# EAGLE design C3-Carrier-RevC (EAGLE 9.7.0)

## Sheet 1 of 4: CHARGING & CELL PROTECTION
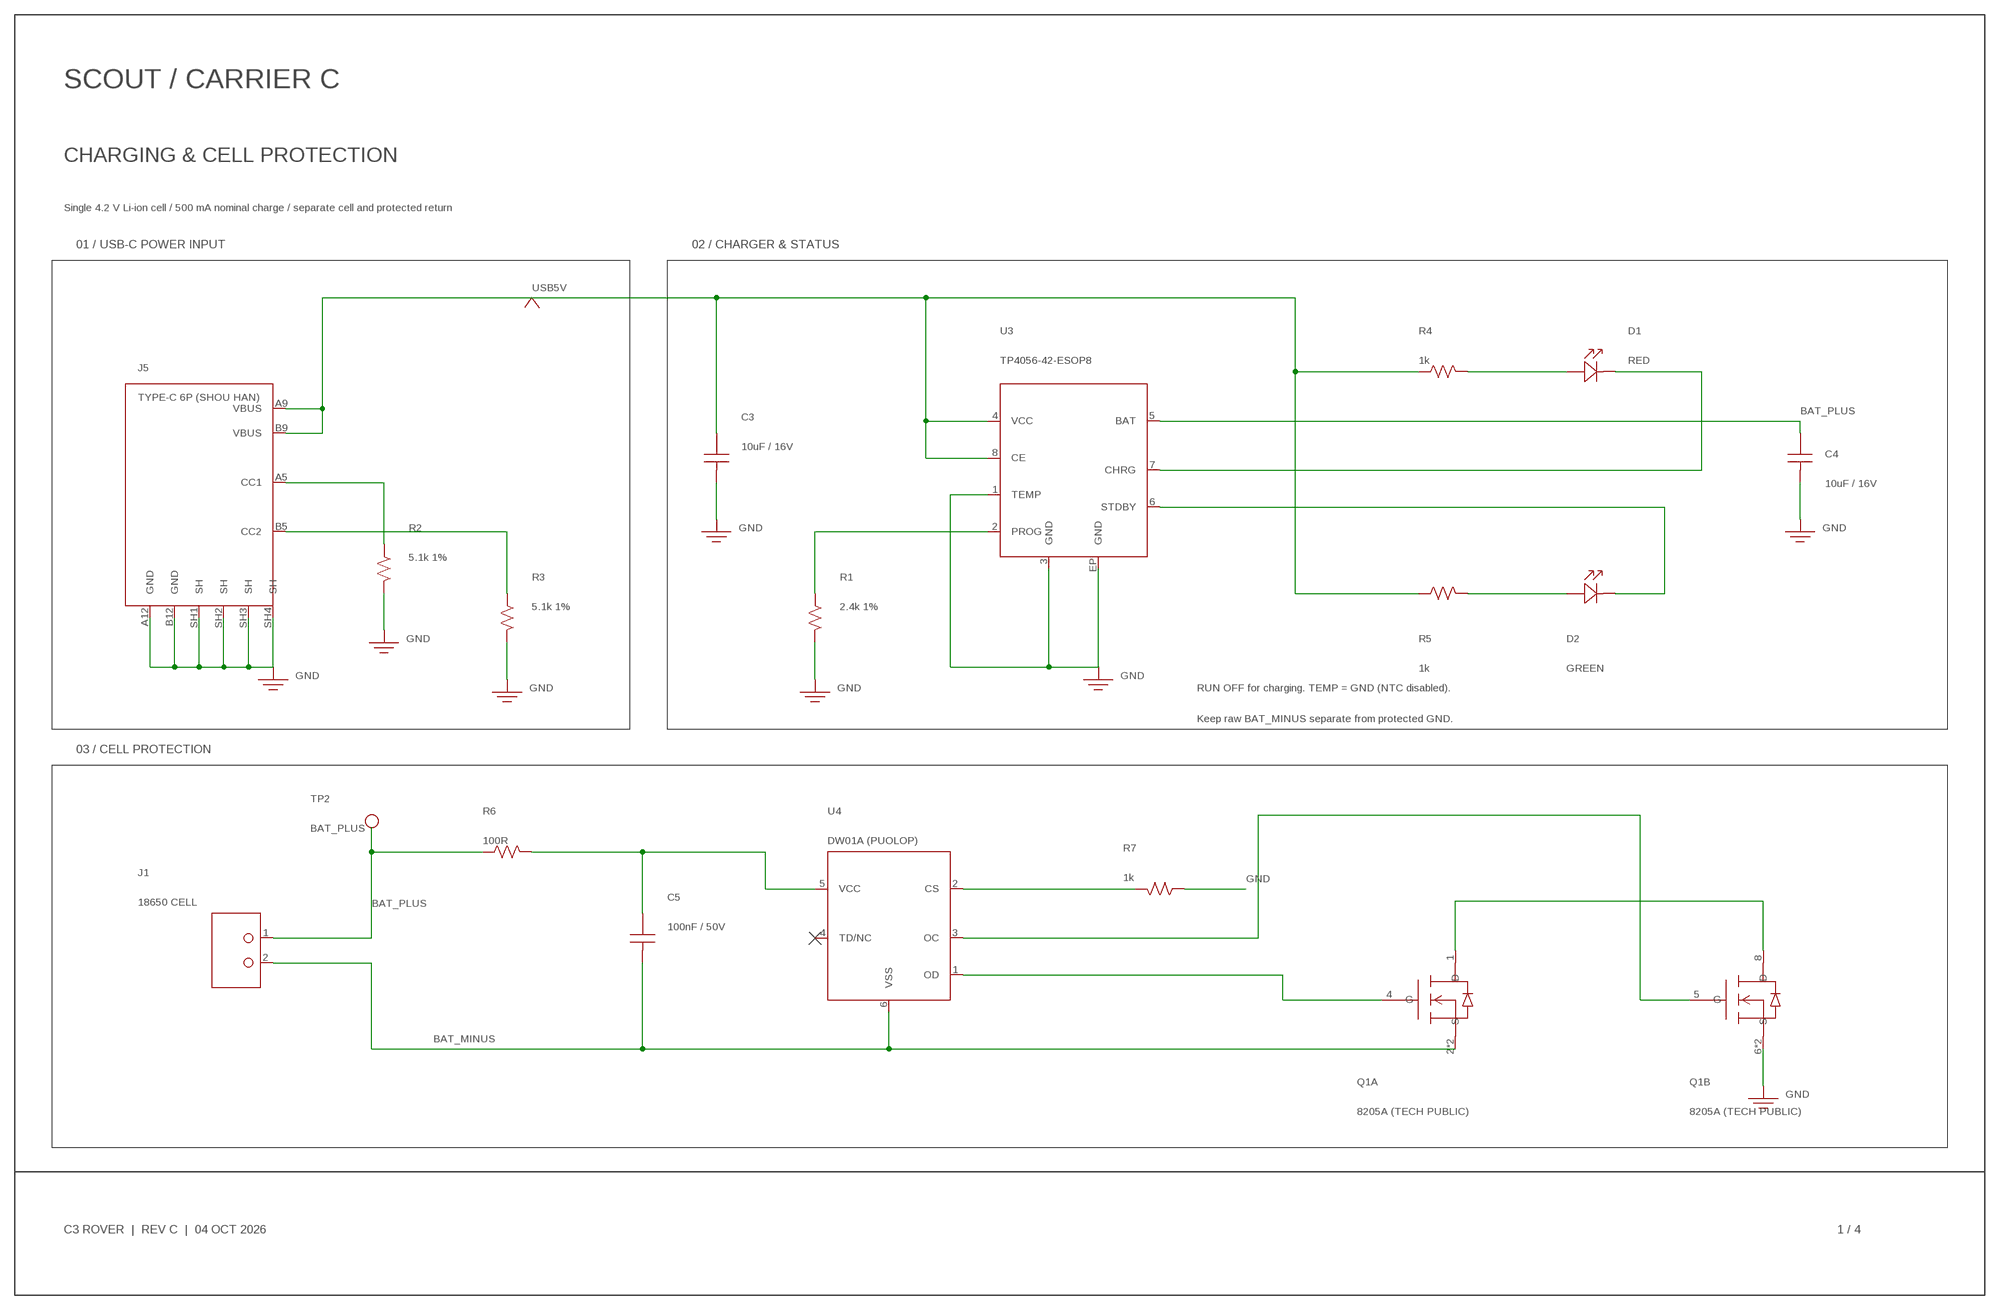
[diagram p0: schematic, sheet 1]

### Parts
C3  10uF / 16V  C1206  [C1206]
C4  10uF / 16V  C1206  [C1206]
C5  100nF / 50V  C0805  [C0805]
D1  RED  LED0805  [LED0805]
D2  GREEN  LED0805  [LED0805]
J1  18650 CELL  WIRE2  [WIRE2-3.5]
J5  TYPE-C 6P (SHOU HAN)  USBC  [USB-C-SHOUHAN-6P-C456012]
Q1  8205A (TECH PUBLIC)  FS8205A  [TSSOP8-0.65]
R1  2.4k 1%  R0805  [R0805]
R2  5.1k 1%  R0805  [R0805]
R3  5.1k 1%  R0805  [R0805]
R4  1k  R0805  [R0805]
R5  1k  R0805  [R0805]
R6  100R  R0805  [R0805]
R7  1k  R0805  [R0805]
TP2  BAT_PLUS  TESTPAD  [TESTPAD]
U3  TP4056-42-ESOP8  TP4056  [ESOP8-EP]
U4  DW01A (PUOLOP)  DW01A  [SOT23-6]

### Nets
BAT_MINUS [POWER]: C5.2 J1.2 Q1.2(A:S) Q1.3(A:S) U4.6(VSS)
BAT_PLUS [POWER]: C4.1 J1.1 R6.1 TP2.1 U3.5(BAT) ; also sheet 2
CC1: J5.A5(CC1) R2.1
CC2: J5.B5(CC2) R3.1
CHRG: D1.2 U3.7(CHRG)
CHRG_LED: D1.1 R4.2
CS: R7.2 U4.2(CS)
D12 [POWER]: Q1.1(A:D) Q1.8(B:D)
DW_VCC: C5.1 R6.2 U4.5(VCC)
FULL_LED: D2.1 R5.2
GND [POWER]: C3.2 C4.2 J5.A12(GND) J5.B12(GND) J5.SH1(SH) J5.SH2(SH) J5.SH3(SH) J5.SH4(SH) Q1.6(B:S) Q1.7(B:S) R1.2 R2.2 R3.2 R7.1 U3.1(TEMP) U3.3(GND) U3.EP(GND) ; also sheet 2,3,4
OC: Q1.5(B:G) U4.3(OC)
OD: Q1.4(A:G) U4.1(OD)
PROG: R1.1 U3.2(PROG)
STDBY: D2.2 U3.6(STDBY)
USB5V [USB]: C3.1 J5.A9(VBUS) J5.B9(VBUS) R4.1 R5.1 U3.4(VCC) U3.8(CE)
Unconnected: U4.4(TD/NC)

### Notes on the sheet
- SCOUT / CARRIER C
- CHARGING & CELL PROTECTION
- Single 4.2 V Li-ion cell / 500 mA nominal charge / separate cell and protected return
- 01 / USB-C POWER INPUT | 02 / CHARGER & STATUS
- RUN OFF for charging. TEMP = GND (NTC disabled).
- Keep raw BAT_MINUS separate from protected GND.
- 03 / CELL PROTECTION
- C3 ROVER  |  REV C  |  04 OCT 2026 | 1 / 4

## Sheet 2 of 4: SWITCHED POWER & 5 V BOOST
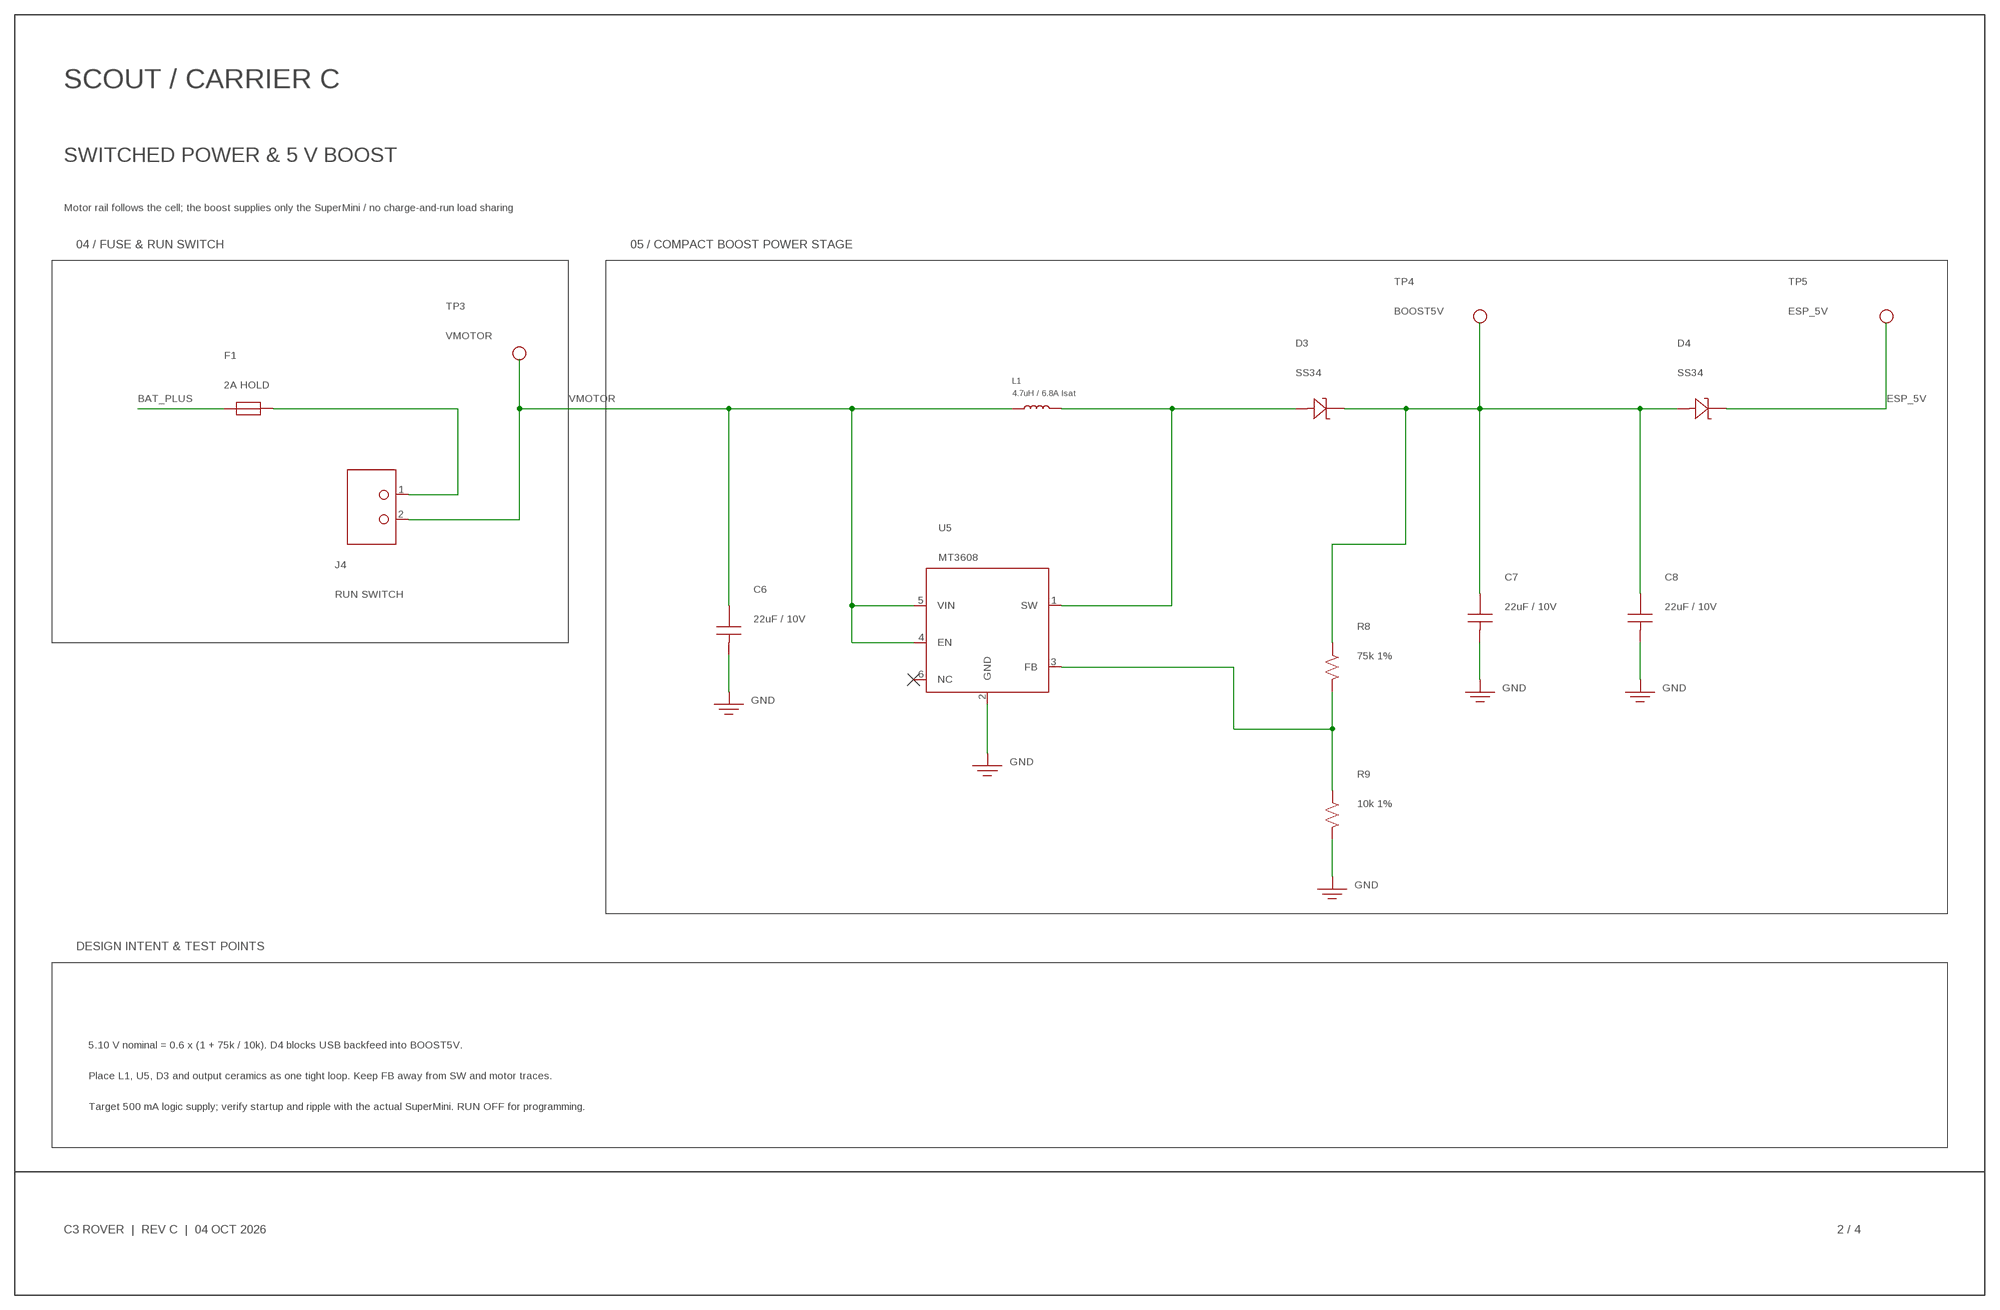
[diagram p1: schematic, sheet 2]

### Parts
C6  22uF / 10V  C1206  [C1206]
C7  22uF / 10V  C1206  [C1206]
C8  22uF / 10V  C1206  [C1206]
D3  SS34  SMA  [SMA]
D4  SS34  SMA  [SMA]
F1  2A HOLD  F1812  [F1812]
J4  RUN SWITCH  WIRE2  [WIRE2-3.5]
L1  4.7uH / 6.8A Isat  L6  [L6]
R8  75k 1%  R0805  [R0805]
R9  10k 1%  R0805  [R0805]
TP3  VMOTOR  TESTPAD  [TESTPAD]
TP4  BOOST5V  TESTPAD  [TESTPAD]
TP5  ESP_5V  TESTPAD  [TESTPAD]
U5  MT3608  [SOT23-6]

### Nets
BAT_PLUS [POWER]: F1.1 ; also sheet 1
BOOST5V [POWER]: C7.1 C8.1 D3.1 D4.2 R8.1 TP4.1
ESP_5V [POWER]: D4.1 TP5.1 ; also sheet 3
FB: R8.2 R9.1 U5.3(FB)
FUSED_BAT [POWER]: F1.2 J4.1
GND [POWER]: C6.2 C7.2 C8.2 R9.2 U5.2(GND) ; also sheet 1,3,4
SW [POWER]: D3.2 L1.2 U5.1(SW)
VMOTOR [POWER]: C6.1 J4.2 L1.1 TP3.1 U5.4(EN) U5.5(VIN) ; also sheet 3,4
Unconnected: U5.6(NC)

### Notes on the sheet
- SCOUT / CARRIER C
- SWITCHED POWER & 5 V BOOST
- Motor rail follows the cell; the boost supplies only the SuperMini / no charge-and-run load sharing
- 04 / FUSE & RUN SWITCH | 05 / COMPACT BOOST POWER STAGE
- DESIGN INTENT & TEST POINTS
- 5.10 V nominal = 0.6 x (1 + 75k / 10k). D4 blocks USB backfeed into BOOST5V.
- Place L1, U5, D3 and output ceramics as one tight loop. Keep FB away from SW and motor traces.
- Target 500 mA logic supply; verify startup and ripple with the actual SuperMini. RUN OFF for programming.
- C3 ROVER  |  REV C  |  04 OCT 2026 | 2 / 4

## Sheet 3 of 4: CONTROLLER & BATTERY SENSING
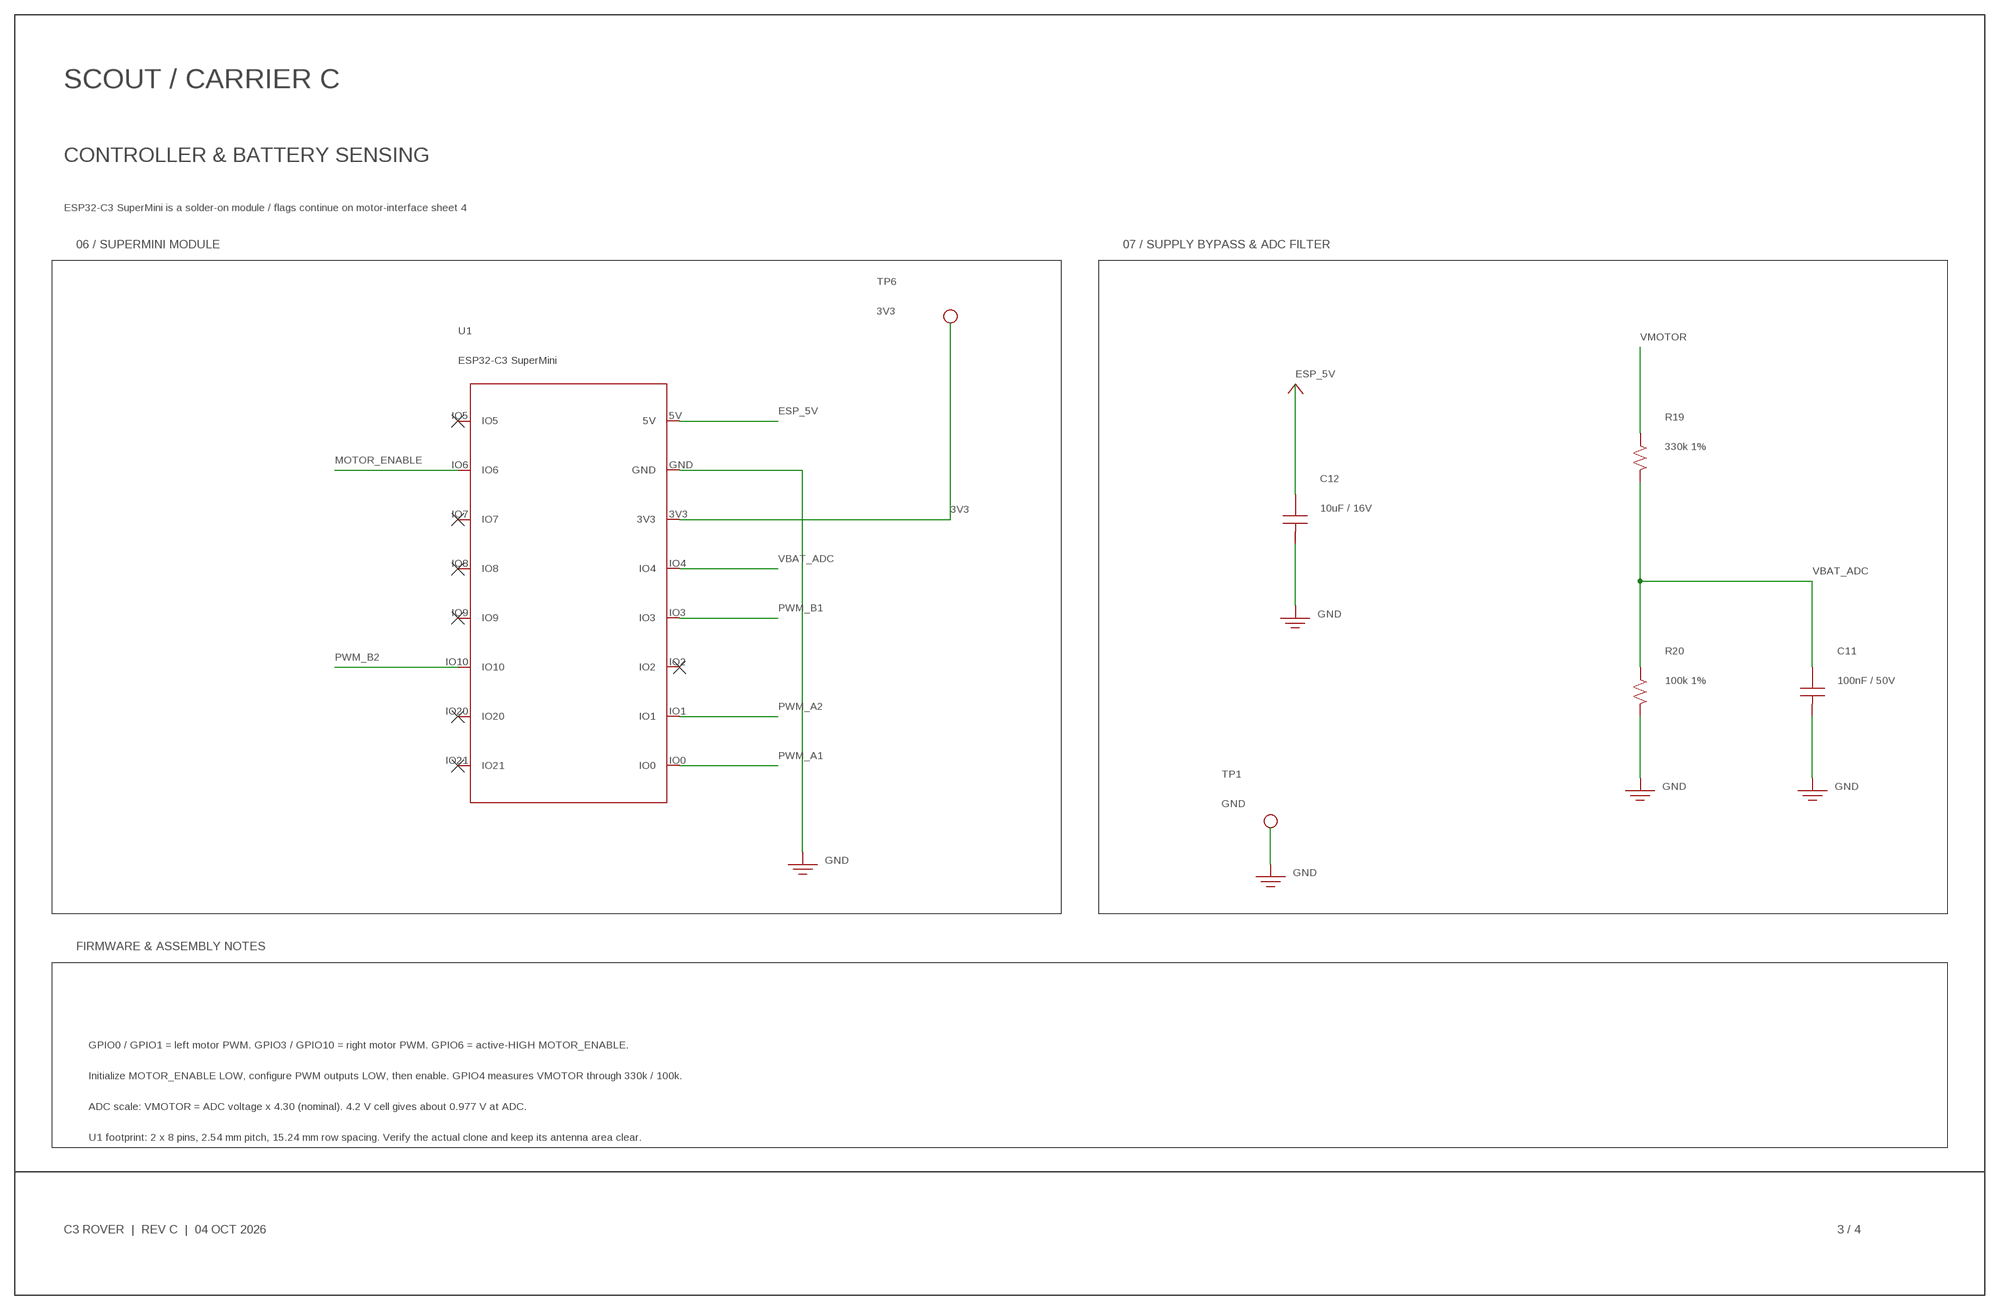
[diagram p2: schematic, sheet 3]

### Parts
C11  100nF / 50V  C0805  [C0805]
C12  10uF / 16V  C1206  [C1206]
R19  330k 1%  R0805  [R0805]
R20  100k 1%  R0805  [R0805]
TP1  GND  TESTPAD  [TESTPAD]
TP6  3V3  TESTPAD  [TESTPAD]
U1  ESP32-C3 SuperMini  SUPERMINI  [SUPERMINI-2X8-15.24]

### Nets
3V3: TP6.1 U1.3V3 ; also sheet 4
ESP_5V [POWER]: C12.1 U1.5V ; also sheet 2
GND [POWER]: C11.2 C12.2 R20.2 TP1.1 U1.GND ; also sheet 1,2,4
MOTOR_ENABLE: U1.IO6 ; also sheet 4
PWM_A1: U1.IO0 ; also sheet 4
PWM_A2: U1.IO1 ; also sheet 4
PWM_B1: U1.IO3 ; also sheet 4
PWM_B2: U1.IO10 ; also sheet 4
VBAT_ADC: C11.1 R19.2 R20.1 U1.IO4
VMOTOR [POWER]: R19.1 ; also sheet 2,4
Unconnected: U1.IO2 U1.IO5 U1.IO7 U1.IO8 U1.IO9 U1.IO20 U1.IO21

### Notes on the sheet
- SCOUT / CARRIER C
- CONTROLLER & BATTERY SENSING
- ESP32-C3 SuperMini is a solder-on module / flags continue on motor-interface sheet 4
- 06 / SUPERMINI MODULE | 07 / SUPPLY BYPASS & ADC FILTER
- FIRMWARE & ASSEMBLY NOTES
- GPIO0 / GPIO1 = left motor PWM. GPIO3 / GPIO10 = right motor PWM. GPIO6 = active-HIGH MOTOR_ENABLE.
- Initialize MOTOR_ENABLE LOW, configure PWM outputs LOW, then enable. GPIO4 measures VMOTOR through 330k / 100k.
- ADC scale: VMOTOR = ADC voltage x 4.30 (nominal). 4.2 V cell gives about 0.977 V at ADC.
- U1 footprint: 2 x 8 pins, 2.54 mm pitch, 15.24 mm row spacing. Verify the actual clone and keep its antenna area clear.
- C3 ROVER  |  REV C  |  04 OCT 2026 | 3 / 4

## Sheet 4 of 4: MOTOR INTERFACE & DUAL H-BRIDGE
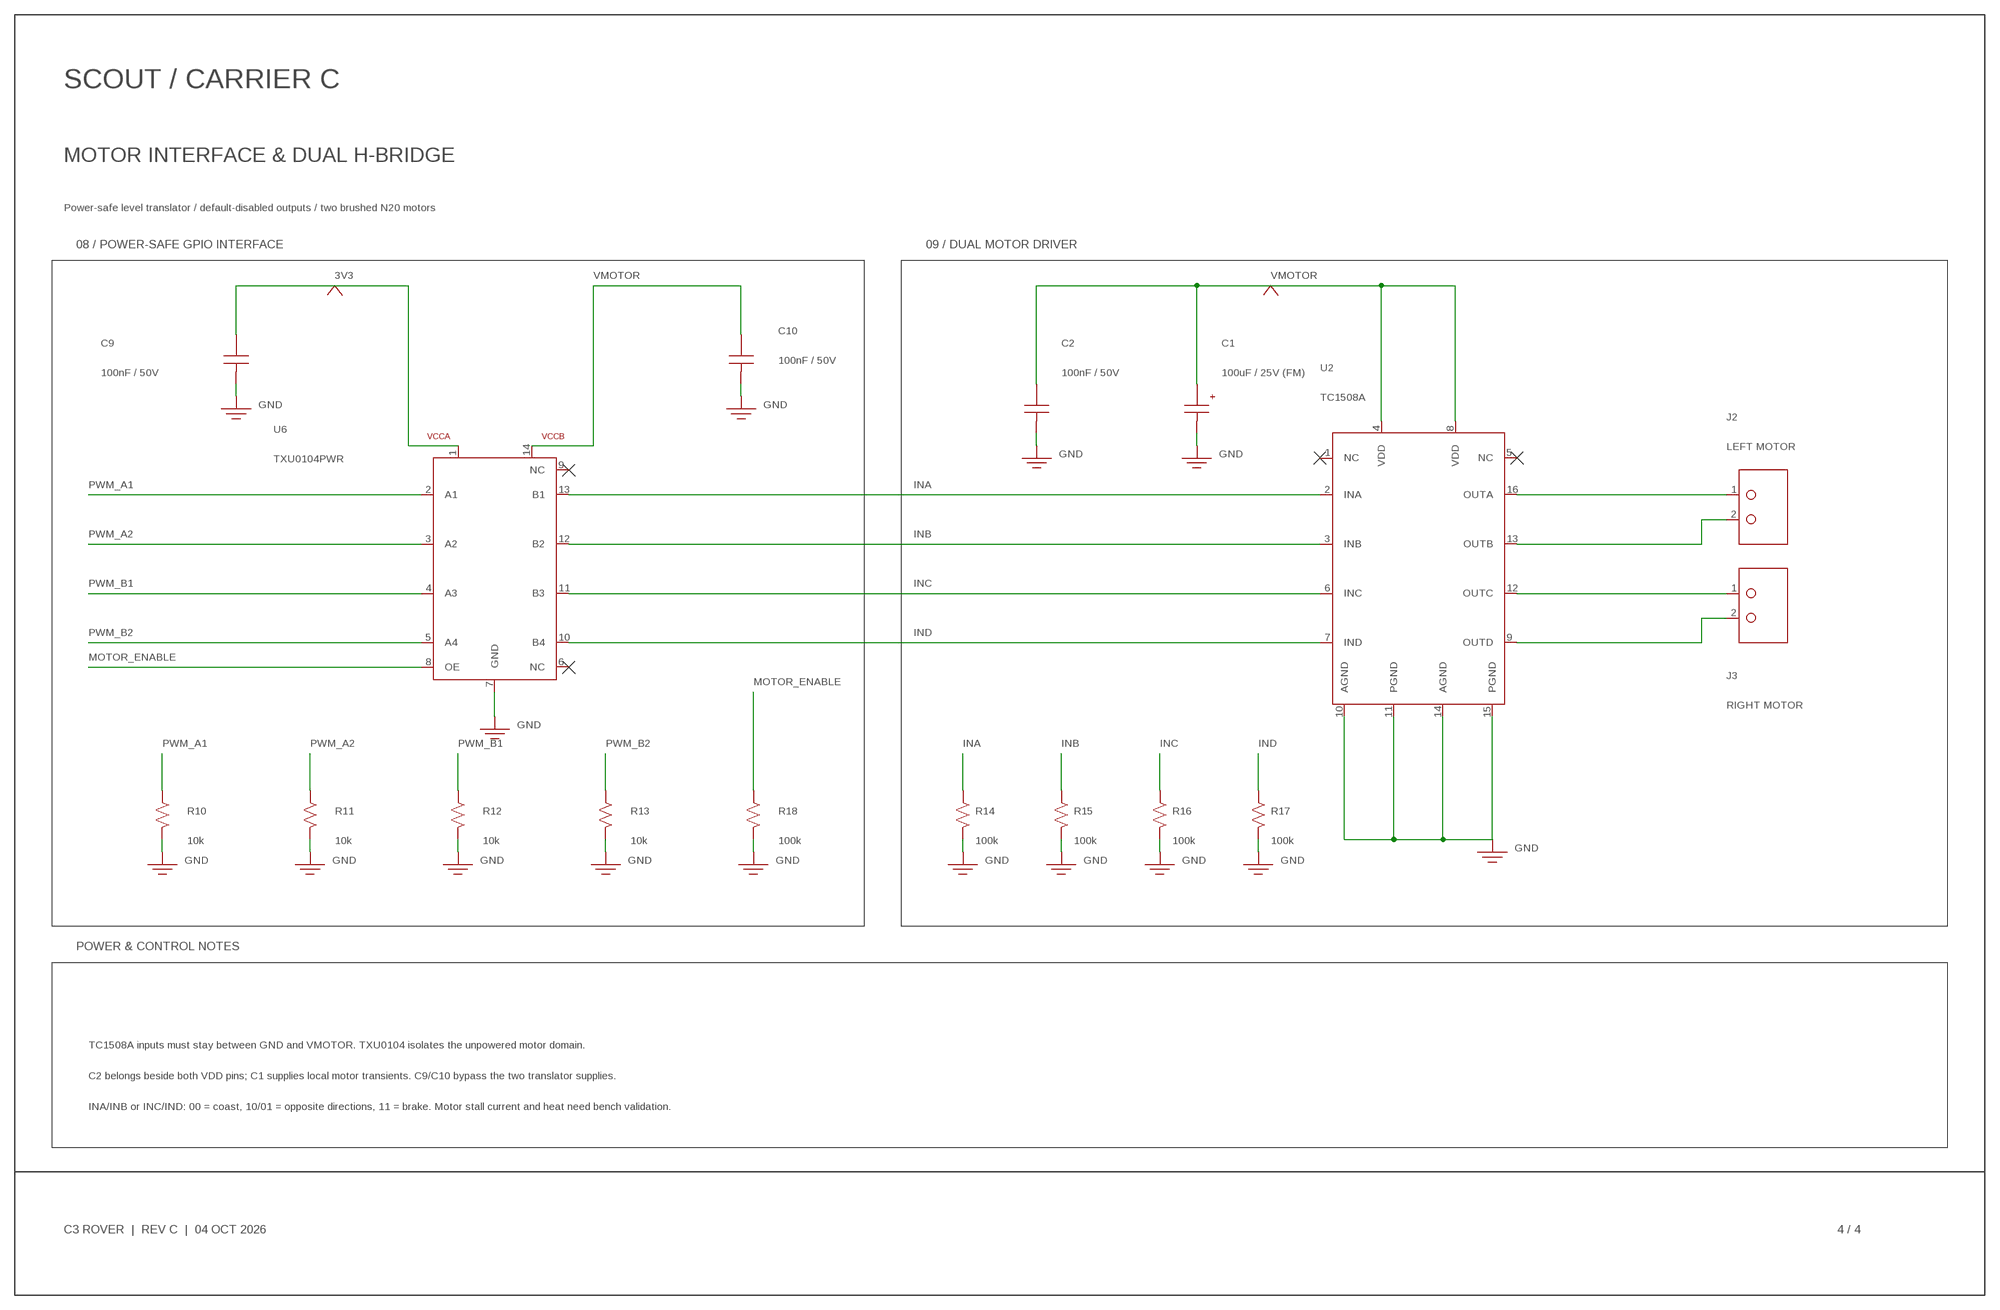
[diagram p3: schematic, sheet 4]

### Parts
C1  100uF / 25V (FM)  RADIAL-6.3-2.5  [RADIAL-6.3-2.5]
C2  100nF / 50V  C0805  [C0805]
C9  100nF / 50V  C0805  [C0805]
C10  100nF / 50V  C0805  [C0805]
J2  LEFT MOTOR  WIRE2_LEFT  [WIRE2-3.5]
J3  RIGHT MOTOR  WIRE2_LEFT  [WIRE2-3.5]
R10  10k  R0805  [R0805]
R11  10k  R0805  [R0805]
R12  10k  R0805  [R0805]
R13  10k  R0805  [R0805]
R14  100k  R0805  [R0805]
R15  100k  R0805  [R0805]
R16  100k  R0805  [R0805]
R17  100k  R0805  [R0805]
R18  100k  R0805  [R0805]
U2  TC1508A  [SOIC16-1.27]
U6  TXU0104PWR  TXU0104  [TSSOP14-0.65]

### Nets
3V3: C9.1 U6.1(VCCA) ; also sheet 3
GND [POWER]: C1.2 C2.2 C9.2 C10.2 R10.2 R11.2 R12.2 R13.2 R14.2 R15.2 R16.2 R17.2 R18.2 U2.10(AGND) U2.11(PGND) U2.14(AGND) U2.15(PGND) U6.7(GND) ; also sheet 1,2,3
INA: R14.1 U2.2(INA) U6.13(B1)
INB: R15.1 U2.3(INB) U6.12(B2)
INC: R16.1 U2.6(INC) U6.11(B3)
IND: R17.1 U2.7(IND) U6.10(B4)
MOTOR_A1 [MOTOR]: J2.1 U2.16(OUTA)
MOTOR_A2 [MOTOR]: J2.2 U2.13(OUTB)
MOTOR_B1 [MOTOR]: J3.1 U2.12(OUTC)
MOTOR_B2 [MOTOR]: J3.2 U2.9(OUTD)
MOTOR_ENABLE: R18.1 U6.8(OE) ; also sheet 3
PWM_A1: R10.1 U6.2(A1) ; also sheet 3
PWM_A2: R11.1 U6.3(A2) ; also sheet 3
PWM_B1: R12.1 U6.4(A3) ; also sheet 3
PWM_B2: R13.1 U6.5(A4) ; also sheet 3
VMOTOR [POWER]: C1.1 C2.1 C10.1 U2.4(VDD) U2.8(VDD) U6.14(VCCB) ; also sheet 2,3
Unconnected: U2.1(NC) U2.5(NC) U6.6(NC) U6.9(NC)

### Notes on the sheet
- SCOUT / CARRIER C
- MOTOR INTERFACE & DUAL H-BRIDGE
- Power-safe level translator / default-disabled outputs / two brushed N20 motors
- 08 / POWER-SAFE GPIO INTERFACE | 09 / DUAL MOTOR DRIVER
- POWER & CONTROL NOTES
- TC1508A inputs must stay between GND and VMOTOR. TXU0104 isolates the unpowered motor domain.
- C2 belongs beside both VDD pins; C1 supplies local motor transients. C9/C10 bypass the two translator supplies.
- INA/INB or INC/IND: 00 = coast, 10/01 = opposite directions, 11 = brake. Motor stall current and heat need bench validation.
- C3 ROVER  |  REV C  |  04 OCT 2026 | 4 / 4

## Library data of the parts
C1 = C3_SCOUT_REVC:RADIAL-6.3-2.5: Panasonic EEUFM1E101 / C713389. 6.3 x 11.2 mm radial, 2.5 mm pitch; 2000 h at 105 C. Pin 1 positive. Factory through-hole assembly.; FUNCTION: MOTOR_INTERFACE; LCSC_PART: C713389; MANUFACTURER: Panasonic; MPN: EEUFM1E101
C2 C9 C10 = C3_SCOUT_REVC:C0805; FUNCTION: MOTOR_INTERFACE
C3 C4 = C3_SCOUT_REVC:C1206; FUNCTION: CHARGE_PROTECT
C5 = C3_SCOUT_REVC:C0805; FUNCTION: CHARGE_PROTECT
C6-C8 = C3_SCOUT_REVC:C1206; FUNCTION: RUN_BOOST
C11 = C3_SCOUT_REVC:C0805; FUNCTION: CONTROLLER
C12 = C3_SCOUT_REVC:C1206; FUNCTION: CONTROLLER
D1 D2 = C3_SCOUT_REVC:LED0805; FUNCTION: CHARGE_PROTECT
D3 D4 = C3_SCOUT_REVC:SMA; FUNCTION: RUN_BOOST
F1 = C3_SCOUT_REVC:F1812; FUNCTION: RUN_BOOST
J1 = C3_SCOUT_REVC:WIRE2; FUNCTION: CHARGE_PROTECT
J2 J3 = C3_SCOUT_REVC:WIRE2_LEFT; FUNCTION: MOTOR_INTERFACE
J4 = C3_SCOUT_REVC:WIRE2; FUNCTION: RUN_BOOST
J5 = C3_SCOUT_REVC:USBC: SHOU HAN TYPE-C 6P / C456012. Power-only 5 V / 3 A, 3000 mating cycles. Matched 0.60 x 1.40 mm native plated-slot footprint; factory assembly.; FUNCTION: CHARGE_PROTECT; LCSC_PART: C456012; MANUFACTURER: SHOU HAN; MPN: TYPE-C 6P
L1 = C3_SCOUT_REVC:L6; FUNCTION: RUN_BOOST
Q1 = C3_SCOUT_REVC:FS8205A: TECH PUBLIC 8205A / C7419210. Dual common-drain TSSOP-8; pads 1/8 drain, 2/3 S1, 4 G1, 5 G2, 6/7 S2. Qualify overcurrent trip with lower RDS(on).; FUNCTION: CHARGE_PROTECT; LCSC_PART: C7419210; MANUFACTURER: TECH PUBLIC; MPN: 8205A
R1-R7 = C3_SCOUT_REVC:R0805; FUNCTION: CHARGE_PROTECT
R8 R9 = C3_SCOUT_REVC:R0805; FUNCTION: RUN_BOOST
R10-R18 = C3_SCOUT_REVC:R0805; FUNCTION: MOTOR_INTERFACE
R19 R20 = C3_SCOUT_REVC:R0805; FUNCTION: CONTROLLER
TP1-TP6 = C3_SCOUT_REVC:TESTPAD; FUNCTION: CONTROLLER
U1 = C3_SCOUT_REVC:SUPERMINI; FUNCTION: CONTROLLER
U2 = C3_SCOUT_REVC:TC1508A; FUNCTION: MOTOR_INTERFACE
U3 = C3_SCOUT_REVC:TP4056; FUNCTION: CHARGE_PROTECT
U4 = C3_SCOUT_REVC:DW01A: PUOLOP DW01A / C351410. SOT23-6 cell protection; 2.5 V cutoff, 2.9 V recovery, supports depleted-cell charging. Prototype protection validation required.; FUNCTION: CHARGE_PROTECT; LCSC_PART: C351410; MANUFACTURER: PUOLOP; MPN: DW01A
U5 = C3_SCOUT_REVC:MT3608; FUNCTION: RUN_BOOST
U6 = C3_SCOUT_REVC:TXU0104; FUNCTION: MOTOR_INTERFACE

## Net classes
0 default: width 0.254 mm, drill 0.3 mm, clearance 0.2 mm
1 POWER: width 0.4 mm, drill 0.3 mm, clearance 0.2 mm to class 0, clearance 0.2 mm
2 MOTOR: width 0.6 mm, drill 0.3 mm, clearance 0.2 mm to class 0, clearance 0.2 mm to class 1, clearance 0.2 mm
3 USB: width 0.4 mm, drill 0.3 mm, clearance 0.2 mm to class 0, clearance 0.2 mm to class 1, clearance 0.2 mm to class 2, clearance 0.2 mm

## Board
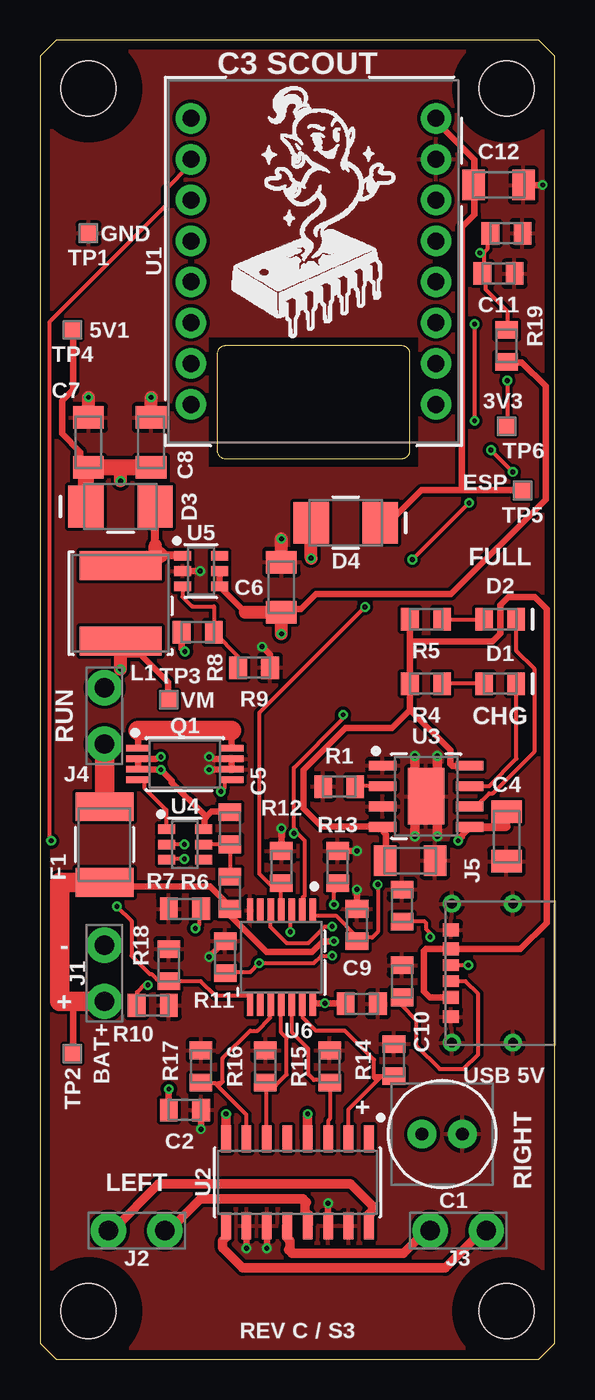
[diagram p4: board, top side]
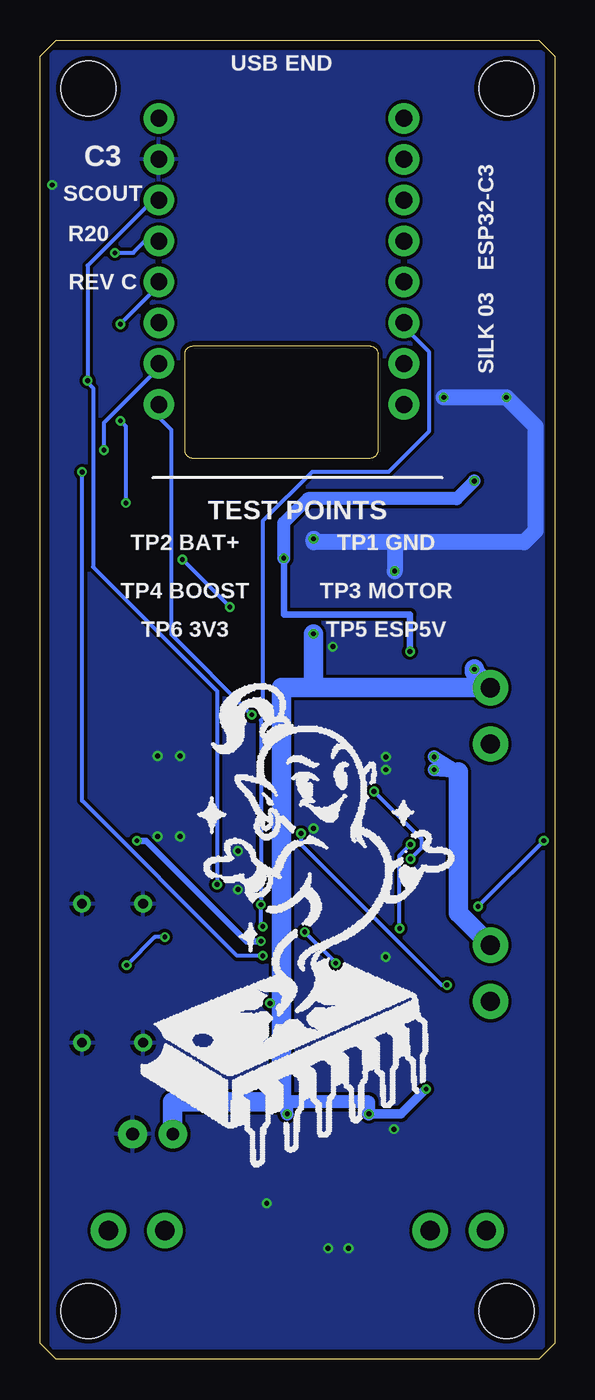
[diagram p5: board, bottom side, seen from below]

Size 32 x 82 mm. Coordinates in mm from the lower left corner, seen from the top.
Outline: 1,0 31,0 32,1 32,81 31,82 1,82 0,81 0,1 1,0
Outline: 22.5,63 11.5,63 arc90 11,62.5 11,56.5 arc90 11.5,56 22.5,56 arc90 23,56.5 23,62.5 arc90 22.5,63
Copper layers (1*16): Top 0.035mm / dielectric 1.53mm / Bottom 0.035mm
Design rules "C3-JLCPCB-2Layer-1oz": minimum track width 0.2mm, minimum drill 0.3mm, track to track 0.2mm, track to pad 0.2mm, pad to pad 0.2mm, via to via 0.2mm, smd to smd 0.2mm, copper to edge 0.3mm, drill to drill 0.45mm, minimum pad ring 0.25mm, minimum via ring 0.15mm, stop-mask expansion 0.01mm, vias tented up to drill 9999mil, thermal gap 10mil
Holes 3.4 mm at 3,3 29,3 3,79 29,79
tRestrict: area -0.4,-0.4 to 6.3,6.3; area 25.6,-0.4 to 32.4,6.3; area -0.4,75.7 to 6.3,82.3; area 25.6,75.7 to 32.4,82.3; area 10.5,55.5 to 23.5,63.5
vRestrict: area -0.4,-0.4 to 6.3,6.3; area 25.6,-0.4 to 32.4,6.3; area -0.4,75.7 to 6.3,82.3; area 25.6,75.7 to 32.4,82.3; area 10.5,55.5 to 23.5,63.5

### Footprints (pad centres in the part's own frame; a part is rotated, then mirrored left to right if it is on the bottom)
RADIAL-6.3-2.5 = drill 0.8 pad 1.8: 1 -1.25,0; 2 1.25,0
C0805 = smd 1.1 x 1.4: 1 -1,0; 2 1,0
C1206 = smd 1.4 x 1.9: 1 -1.55,0; 2 1.55,0
LED0805 = smd 1.1 x 1.4: 1 -1,0; 2 1,0
SMA = smd 2.2 x 2.6: 1 -2.15,0; 2 2.15,0
F1812 = smd 1.8 x 3.6: 1 -2.35,0; 2 2.35,0
WIRE2-3.5 = drill 1.2 pad 2.2: 1 -1.75,0; 2 1.75,0
USB-C-SHOUHAN-6P-C456012 = smd 0.7 x 1: A5 -0.5,3.05; B5 0.5,3.05 | smd 0.8 x 1: A9 1.5,3.05; A12 2.7,3.05; B9 -1.5,3.05; B12 -2.7,3.05 | drill 0.6 pad 1 slot 1.4 rotated 90: SH1 -4.32,3; SH2 -4.32,-0.8; SH3 4.32,3; SH4 4.32,-0.8
L6 = smd 1.8 x 5.1: 1 -2.35,0; 2 2.35,0
TSSOP8-0.65 = smd 1.5 x 0.4: 1 -2.9,0.975; 2 -2.9,0.325; 3 -2.9,-0.325; 4 -2.9,-0.975; 5 2.9,-0.975; 6 2.9,-0.325; 7 2.9,0.325; 8 2.9,0.975
R0805 = smd 1.1 x 1.4: 1 -1,0; 2 1,0
TESTPAD = smd 1.1 x 1.1: 1 0,0
SUPERMINI-2X8-15.24 = drill 1.05 pad 1.9: 3V3 7.62,3.81; 5V 7.62,8.89; GND 7.62,6.35; IO0 7.62,-8.89; IO1 7.62,-6.35; IO2 7.62,-3.81; IO3 7.62,-1.27; IO4 7.62,1.27; IO5 -7.62,8.89; IO6 -7.62,6.35; IO7 -7.62,3.81; IO8 -7.62,1.27; IO9 -7.62,-1.27; IO10 -7.62,-3.81; IO20 -7.62,-6.35; IO21 -7.62,-8.89
SOIC16-1.27 = smd 1.7 x 0.6: 1 -2.7,4.445; 2 -2.7,3.175; 3 -2.7,1.905; 4 -2.7,0.635; 5 -2.7,-0.635; 6 -2.7,-1.905; 7 -2.7,-3.175; 8 -2.7,-4.445; 9 2.7,-4.445; 10 2.7,-3.175; 11 2.7,-1.905; 12 2.7,-0.635; 13 2.7,0.635; 14 2.7,1.905; 15 2.7,3.175; 16 2.7,4.445
ESOP8-EP = smd 1.7 x 0.6: 1 -2.7,1.905; 2 -2.7,0.635; 3 -2.7,-0.635; 4 -2.7,-1.905; 5 2.7,-1.905; 6 2.7,-0.635; 7 2.7,0.635; 8 2.7,1.905 | smd 2.25 x 3.5: EP 0,0
SOT23-6 = smd 1.05 x 0.6: 1 -1.15,0.95; 2 -1.15,0; 3 -1.15,-0.95; 4 1.15,-0.95; 5 1.15,0; 6 1.15,0.95
TSSOP14-0.65 = smd 1.5 x 0.4: 1 -2.9,1.95; 2 -2.9,1.3; 3 -2.9,0.65; 4 -2.9,0; 5 -2.9,-0.65; 6 -2.9,-1.3; 7 -2.9,-1.95; 8 2.9,-1.95; 9 2.9,-1.3; 10 2.9,-0.65; 11 2.9,0; 12 2.9,0.65; 13 2.9,1.3; 14 2.9,1.95

### Placement (x,y rotation side)
C1  25,14 0 top
C2  9,15.5 0 top
C3  23,31 0 top
C4  29,32.5 270 top
C5  11.8,33 90 top
C6  15,48 90 top
C7  3,57 90 top
C8  6.9,57 90 top
C9  19.7,27 90 top
C10  20,22.1 0 top
C11  28.5,67.5 0 top
C12  28.5,73 0 top
D1  28.6,42 0 top
D2  28.6,46 0 top
D3  5,53 0 top
D4  19,52 180 top
F1  4,32 90 top
J1  4,24 90 top
J2  6,8 0 top
J3  26,8 0 top
J4  4,40 90 top
J5  28.6,24 90 top
L1  5,47 90 top
Q1  9,37 0 top
R1  18.6,35.6 180 top
R2  22.5,23.5 90 top
R3  22.5,28.2 90 top
R4  24,42 0 top
R5  24,46 0 top
R6  11.8,29 90 top
R7  9,28 0 top
R8  9.8,45.2 0 top
R9  13.3,43 0 top
R10  7,22 0 top
R11  11.5,25 90 top
R12  15,30.6 90 top
R13  18.5,30.6 90 top
R14  22,18.6 90 top
R15  18,18.2 90 top
R16  14,18.2 90 top
R17  10,18.2 90 top
R18  8,24.5 90 top
R19  29,63 90 top
R20  29,70 0 top
TP1  3,70 0 top
TP2  2,19 0 top
TP3  8,41 0 top
TP4  2,64 0 top
TP5  30,54 0 top
TP6  29,58 0 top
U1  17,68.25 0 top
U2  16,11 270 top
U3  24,35 0 top
U4  9,32 0 top
U5  10,49 0 top
U6  15,25 270 top

### Tracks (layer width: path | path; a pad name or v marks a point on that pad's centre or on a via)
3V3  (via drill 0.3)
  Top 0.254: U6.1 16.91,27.81 16.91,27.69 17.02,27.58 18.39,27.58 19.64,26.33 19.64,26.11 C9.1 19.75,26.22 20.66,26.22 21,26.56 v21,29.51 | v29.06,60.84 29.06,58.11 TP6.1
  Bottom 0.254: U1.3V3 24.63,71.96 25.08,71.96 29.06,67.99 v29.06,60.84 29.06,60.72 28.71,60.38 28.71,49.26 21,41.54 v21,29.51
BAT_MINUS  (via drill 0.3 pad 0.6)
  Top 0.4: v7.5,37.45 7.15,37.33 Q1.2 Q1.3 7.15,36.67 v7.5,36.65 7.6,36.55 8.17,35.98 8.17,35.87 10.21,33.82 10.33,33.71 | 10.33,33.71 10.67,34.05 11.69,34.05 C5.2 | 10.33,33.71 10.21,33.6 10.21,33.03 U4.6
  Bottom 0.8: v7.5,36.65 6,36.5 v7.5,37.45
  Bottom 1.2: J1.2 6,27.75 6,36.5
BAT_PLUS  (via drill 0.3)
  Top 0.4: TP2.1 2.04,19.07 2.04,21.68 2.04,22.25 | F1.1 4.54,29.4 10.56,29.4 11.69,28.26 11.69,28.04 R6.1 11.8,27.81 11.8,27.58 14.07,25.31 16.91,25.31 17.59,25.99 v18.27,25.99 | v25.99,32.23 26.22,32.46 26.22,32.58 26.56,32.91 U3.5
  Top 0.5: U3.5 29,33.09 C4.1
  Top 1.2: J1.1 2.04,22.25 1.2,22.25 1.2,29.65 F1.1
  Bottom 0.4: v25.99,32.23 25.42,32.23 19.18,25.99 v18.27,25.99
BOOST5V  (via drill 0.3 pad 0.6)
  Top 0.4: R8.1 8.8,44.2 v9,44 | TP4.1 2.04,63.9 2.04,60.27 1.36,59.59 1.36,57.54 2.5,56.41 2.5,55.73 C7.1 2.95,55.27 2.85,55.27 | 4.88,55.45 4.88,55.5 5,55.45
  Top 0.8: v5,54.6 5,55.45 | v16.85,49.8 D4.2
  Top 1: D3.1 2.85,55.27 2.85,55.45 C7.1 4.88,55.45 5,55.45 C8.1
  Bottom 0.4: v9,44 9,46.3 16.85,46.3 v16.85,49.8
  Bottom 0.8: v5,54.6 6.1,53.5 15.35,53.5 D4.2 v16.85,49.8
CC1
  Top 0.254: J5.A5 25.54,23.49 26.45,23.49 27.24,22.7 27.24,18.95 26.33,18.05 24.86,18.05 23.38,19.52 23.38,21.11 22.47,22.02 22.47,22.47 R2.1
CC2  (via drill 0.3)
  Top 0.254: v26.62,24.5 25.62,24.5 J5.B5 | v24.25,26.25 24.25,26.5 24,26.75 24,27.12 23.88,27.25 22.5,27.25 R3.1
  Bottom 0.254: v26.62,24.5 24.88,26.25 v24.25,26.25
CHRG
  Top 0.254: D1.2 29.62,41.99 29.62,37.34 27.92,35.64 26.79,35.64 U3.7
CHRG_LED
  Top 0.254: R4.2 25.08,41.99 27.58,41.99 D1.1
CS  (via drill 0.3)
  Top 0.254: v8.97,32.01 7.95,32.01 U4.2 | v9.65,26.79 9.87,27.01 9.87,27.81 9.99,27.92 R7.2
  Bottom 0.254: v8.97,32.01 9.65,31.33 v9.65,26.79
D12
  Top 0.4: Q1.1 6.1,39.1 11.9,39.1 Q1.8
  Top 1.2: 6.1,39.1 11.9,39.1
DW_VCC
  Top 0.254: U4.5 10.21,32.01 11.69,32.01 C5.1 11.8,31.89 11.8,30.08 R6.2
ESP_5V
  Top 0.4: U1.5V 24.52,77.07 27.01,74.57 27.01,73.09 C12.1 27.01,72.87 27.01,71.17 26.22,70.37 26.22,54.14 26.22,54.03 | 26.22,54.03 23.72,54.03 21.79,52.1 21.22,52.1 D4.1 | 26.22,54.03 29.96,54.03 TP5.1
FB
  Top 0.254: U5.3 8.85,47.4 9.45,46.8 10.8,46.8 R8.2 12.3,43.7 R9.1
FULL_LED
  Top 0.254: R5.2 25.08,45.97 27.58,45.97 D2.1
FUSED_BAT
  Top 1.2: F1.2 J4.1
GND  (via drill 0.3 pad 0.6)
  Top 0.4: U5.2 v9.95,49 | R9.2 14.3,43.8 v13.8,44.3 | v10.5,36.65 10.85,36.67 Q1.6 Q1.7 10.85,37.33 v10.5,37.45 | C2.2 v10,14.3 | R11.2 v10.51,25.01 | U2.10 v12.82,6.9 | U2.11 v14.1,6.9 | U2.14 v17.91,9.7 | C9.2 v19.7,29.2 | C12.2 v31.25,73 | R12.2 v15,33 | R13.2 v19.7,31.6
  Top 0.6: v23.3,32.5 23.3,35 v23.3,37.5 | v24.7,32.5 24.7,35 v24.7,37.5
  Top 0.8: C6.2 v15,51 | C7.2 v3,59.8 | C8.2 v6.9,59.8
  Bottom 1: v6.9,59.8 v3,59.8 1.2,58 1.2,51.5 1.9,50.8 9.5,50.8 9.95,50.8 | 9.95,50.8 v9.95,49 | 9.95,50.8 15,50.8 v15,51
  pour Top: 0.73,0.73 31.27,0.73 31.27,81.27 0.73,81.27
  pour Bottom: 0.73,0.73 31.27,0.73 31.27,81.27 0.73,81.27
INA
  Top 0.254: 21.22,17.59 21.91,17.59 R14.1 | 20.94,17.31 19.18,15.55 19.18,13.73 U2.2 | 20.94,17.31 21.22,17.59 | 20.77,17.48 20.77,18.61 18.95,20.43 17.14,20.43 16.34,21.22 16.34,22.02 U6.13 | 20.77,17.48 20.88,17.37 20.94,17.31 | 21.22,17.59 21.18,17.59 20.82,17.59 20.77,17.48
INB
  Top 0.254: U2.3 17.93,13.73 17.93,14.87 18.05,14.98 18.05,17.14 R15.1 17.93,17.25 17.82,17.37 17.02,17.37 16.68,17.71 16.68,19.3 15.66,20.32 15.66,22.02 U6.12
INC
  Top 0.254: U2.6 14.07,13.73 14.07,17.14 R16.1 14.19,17.02 14.64,17.02 15.32,17.71 15.32,19.98 14.98,20.32 14.98,22.02 U6.11
IND
  Top 0.254: 10.9,17.14 10.1,17.14 R17.1 | 11.07,16.97 12.82,15.21 12.82,13.73 U2.7 | 11.07,16.97 10.9,17.14 | 11.35,17.25 11.35,18.73 13.05,20.43 13.51,20.43 14.3,21.22 14.3,22.02 U6.10 | 11.35,17.25 11.12,17.02 11.07,16.97 | 10.9,17.14 10.94,17.15 11.3,17.24 11.35,17.25
MOTOR_A1
  Top 0.6: U2.16 20.43,8.4 20.43,8.97 20.66,9.19 20.66,9.53 19.3,10.9 7.38,10.9 4.54,8.06 4.31,8.06 J2.1
MOTOR_A2
  Top 0.6: U2.13 16.68,8.4 16.68,8.97 16.46,9.19 16.46,9.65 16.57,9.76 16.34,9.99 9.99,9.99 8.06,8.06 7.83,8.06 J2.2
MOTOR_B1
  Top 0.6: U2.12 15.32,8.29 15.32,7.6 15.55,7.38 15.55,6.92 15.44,6.81 15.66,6.58 22.59,6.58 23.95,7.95 24.18,7.95 J3.1
MOTOR_B2
  Top 0.6: U2.9 11.58,8.29 11.58,7.6 11.35,7.38 11.35,6.92 12.6,5.67 25.2,5.67 27.47,7.95 27.69,7.95 J3.2
MOTOR_ENABLE  (via drill 0.3)
  Top 0.254: U6.8 13.05,22.13 13.05,22.47 12.94,22.59 10.9,22.59 9.99,23.49 8.06,23.49 R18.1 7.95,23.61 7.26,23.61 6.92,23.95 6.81,23.95 5.67,25.08 5.67,27.24 v4.77,28.15 | v0.68,32.23 0.57,32.35 0.57,64.47 7.83,71.73 7.83,72.75 9.31,74.23 9.31,74.57 U1.IO6
  Bottom 0.254: v0.68,32.23 v4.77,28.15
OC  (via drill 0.3)
  Top 0.254: v8.97,31.1 7.95,31.1 U4.3 | v11.24,35.3 11.46,35.53 11.46,35.87 11.58,35.98 11.8,35.98 Q1.5
  Bottom 0.254: v8.97,31.1 8.29,31.78 8.29,32.35 v11.24,35.3
OD
  Top 0.254: U4.1 7.83,33.03 7.83,34.16 6.47,35.53 6.47,35.87 6.36,35.98 6.13,35.98 Q1.4
PROG
  Top 0.254: R1.1 19.64,35.64 21.22,35.64 U3.2
PWM_A1  (via drill 0.3)
  Top 0.254: v6.7,23.27 6.47,23.27 6.02,22.81 6.02,22.02 R10.1 | U6.2 16.34,27.92 16.34,28.71 16.46,28.83 16.46,32.23 15.89,32.8 v15.78,32.69 15.89,32.91 15.78,33.03 15.78,36.77 18.84,39.84 v18.84,40.07
  Bottom 0.254: v6.7,23.27 7.04,23.27 15.78,32.01 v15.78,32.69 | v18.84,40.07 23.84,45.06 23.84,57.77 24.52,58.45 24.52,59.25 U1.IO0
PWM_A2  (via drill 0.3)
  Top 0.254: v15.55,26.56 15.55,27.81 U6.3 | R11.1 11.58,24.06 13.05,24.06 v13.62,24.63 13.73,24.63 17.02,24.63 17.48,25.08 v18.16,25.08 | v29.4,55.16 v28.04,56.52
  Bottom 0.254: v15.55,26.56 v13.62,24.63 | v28.04,56.52 28.04,58.23 24.63,61.63 24.63,61.86 U1.IO1 | v29.4,55.16 29.4,34.73 19.75,25.08 v18.16,25.08
PWM_B1  (via drill 0.3)
  Top 0.254: U6.4 14.98,27.92 14.98,29.51 R12.1 14.87,29.51 14.3,29.51 13.62,30.19 13.62,40.18 v20.2,46.76 | v26.67,53.23 v23.15,49.71 | v27.01,64.36 v27.01,58.34
  Bottom 0.254: v23.15,49.71 v20.2,46.76 | v26.67,53.23 26.67,58 v27.01,58.34 | v27.01,64.36 24.63,66.74 24.63,66.97 U1.IO3
PWM_B2  (via drill 0.3)
  Top 0.254: v18.27,28.26 18.27,29.06 18.39,29.17 18.39,29.51 R13.1 | v18.16,26.9 17.71,26.9 16.68,25.88 15.32,25.88 14.3,26.9 14.3,27.81 U6.5
  Bottom 0.254: v18.16,26.9 18.27,27.01 v18.27,28.26 18.27,28.38 18.27,39.73 18.16,39.84 18.16,52.1 15.1,55.16 10.33,55.16 7.83,57.66 7.83,62.65 9.31,64.13 9.31,64.36 U1.IO10
STDBY
  Top 0.254: D2.2 29.62,45.97 29.62,44.04 30.76,42.9 30.76,37.8 28.15,35.19 27.92,35.19 27.13,34.39 26.79,34.39 U3.6
SW
  Top 0.5: U5.1 7.8,49.95 | 7.8,49.95 7.15,50.6 D3.2 | 7.8,49.95 7.66,49.85 7.41,49.68 7.15,49.5
  Top 0.8: L1.2 7.15,49.5 7.15,50.6
USB5V
  Top 0.4: C3.1 21.5,31 21.5,32.62 21.38,32.75 21.38,33 U3.4 21.12,33.12 17.5,33.12 16.38,34.25 16.38,36.62 19,39.25 21.88,39.25 22.88,40.25 23,40.38 | J5.B9 25.5,22.5 24.25,22.5 23.88,22.88 23.88,25.38 24,25.5 25.5,25.5 J5.A9 25.62,25.5 29.88,25.5 31.5,27.12 31.5,46.62 30.75,47.38 29.12,47.38 28.62,46.88 28.62,45.12 28.12,44.62 23.12,44.62 23,44.62 | R5.1 23,44.62 | 23,44.62 R4.1 23,41.88 23,40.38 | 23,40.38 25.5,37.88 25.5,37 25.62,36.88 26.62,36.88 U3.8
VBAT_ADC  (via drill 0.3)
  Top 0.254: 27.58,68.78 27.58,67.53 C11.1 27.69,67.53 27.69,66.51 29.06,65.15 29.06,64.01 R19.2 | 27.58,68.78 27.81,69.01 27.81,69.8 27.92,69.92 R20.1 | v27.35,68.78 27.47,68.78 27.58,68.78
  Bottom 0.254: v27.35,68.78 26.22,68.78 25.54,69.46 24.63,69.46 U1.IO4
VMOTOR  (via drill 0.3, 0.3 pad 0.6)
  Top 0.4: U5.5 U5.4 12.75,46.45 | C2.1 v8,16.8 | C10.1 18.95,22.13 v17.71,22.13 17.02,22.13 U6.14 | TP3.1 7.95,41.09 7.95,42.11 6.24,43.81 5.33,43.81 L1.1 | R19.1 29.06,61.97 29.96,61.97 31.44,60.49 31.44,53.46 25.54,47.56 17.14,47.56 16.23,46.65 15.32,46.65 C6.1
  Top 0.6: U2.8 v11.55,15.25 | U2.4 v16.64,15.25
  Top 0.8: 12.75,46.45 C6.1 v15,45.1 | v5,42.9 L1.1
  Bottom 0.4: v17.71,22.13 17.59,22.13 17,22.13
  Bottom 0.6: v8,16.8 9.55,15.25 v11.55,15.25
  Bottom 0.8: v11.55,15.25 11.55,16 17,16 16.64,16 v16.64,15.25
  Bottom 1.2: 7.25,41.75 J4.2 5,42.75 v5,42.9 | 7.25,41.75 17,41.75 17,22.13 17,16 23.75,16 C1.1 | 7.25,41.75 15,41.75 v15,45.1

### Text on the board
tPlace: C3 SCOUT | GND | 5V1 | 3V3 | ESP | FULL | VM | RUN | CHG | - | + | BAT+ | USB 5V | + | RIGHT | LEFT | REV C / S3
bPlace: USB END | C3 | SCOUT | ESP32-C3 | REV C | SILK 03 | TEST POINTS | TP1 GND | TP2 BAT+ | TP3 MOTOR | TP4 BOOST | TP5 ESP5V | TP6 3V3